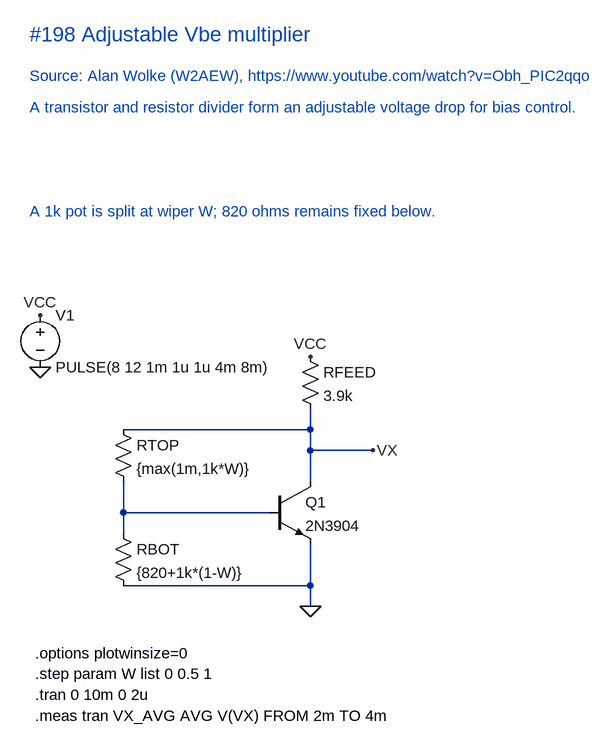
[diagram p0: schematic Adjustable Vbe multiplier.asc]
Adjustable Vbe multiplier.asc, the LTspice schematic file:
Version 4.1
SHEET 1 1050 700
WIRE 544 96 544 64
WIRE 544 128 544 96
WIRE 544 176 544 128
WIRE 640 128 544 128
WIRE 256 96 544 96
WIRE 256 224 256 176
WIRE 480 224 256 224
WIRE 256 256 256 224
WIRE 544 336 544 272
WIRE 544 368 544 336
WIRE 544 336 256 336
FLAG 128 -80 VCC
FLAG 128 0 0
FLAG 544 -16 VCC
FLAG 544 368 0
FLAG 640 128 VX
SYMBOL voltage 128 -96 R0
SYMATTR InstName V1
SYMATTR Value PULSE(8 12 1m 1u 1u 4m 8m)
SYMBOL res 528 -32 R0
SYMATTR InstName RFEED
SYMATTR Value 3.9k
SYMBOL npn 480 176 R0
SYMATTR InstName Q1
SYMATTR Value 2N3904
SYMBOL res 240 80 R0
SYMATTR InstName RTOP
SYMATTR Value {max(1m,1k*W)}
SYMBOL res 240 240 R0
SYMATTR InstName RBOT
SYMATTR Value {820+1k*(1-W)}
TEXT 120 440 Left 2 !.options plotwinsize=0
TEXT 120 472 Left 2 !.step param W list 0 0.5 1
TEXT 120 504 Left 2 !.tran 0 10m 0 2u
TEXT 120 536 Left 2 !.meas tran VX_AVG AVG V(VX) FROM 2m TO 4m
TEXT 112 -240 Left 2 ;A 1k pot is split at wiper W; 820 ohms remains fixed below.
TEXT 112 -512 Left 3 ;#198 Adjustable Vbe multiplier
TEXT 112 -448 Left 2 ;Source: Alan Wolke (W2AEW), https://www.youtube.com/watch?v=Obh_PIC2qqo
TEXT 112 -400 Left 2 ;A transistor and resistor divider form an adjustable voltage drop for bias control.

The netlist it stands for:
* Adjustable Vbe multiplier.asc
V1 VCC 0 PULSE(8 12 1m 1u 1u 4m 8m)
RFEED VCC VX 3.9k
Q1 VX N001 0 0 2N3904
RTOP VX N001 {max(1m,1k*W)}
RBOT N001 0 {820+1k*(1-W)}
.model NPN NPN
.model PNP PNP
.lib standard.bjt
.options plotwinsize=0
.step param W list 0 0.5 1
.tran 0 10m 0 2u
.meas tran VX_AVG AVG V(VX) FROM 2m TO 4m
* A 1k pot is split at wiper W; 820 ohms remains fixed below.
* #198 Adjustable Vbe multiplier
* Source: Alan Wolke (W2AEW), https://www.youtube.com/watch?v=Obh_PIC2qqo
* A transistor and resistor divider form an adjustable voltage drop for bias control.
.backanno
.end